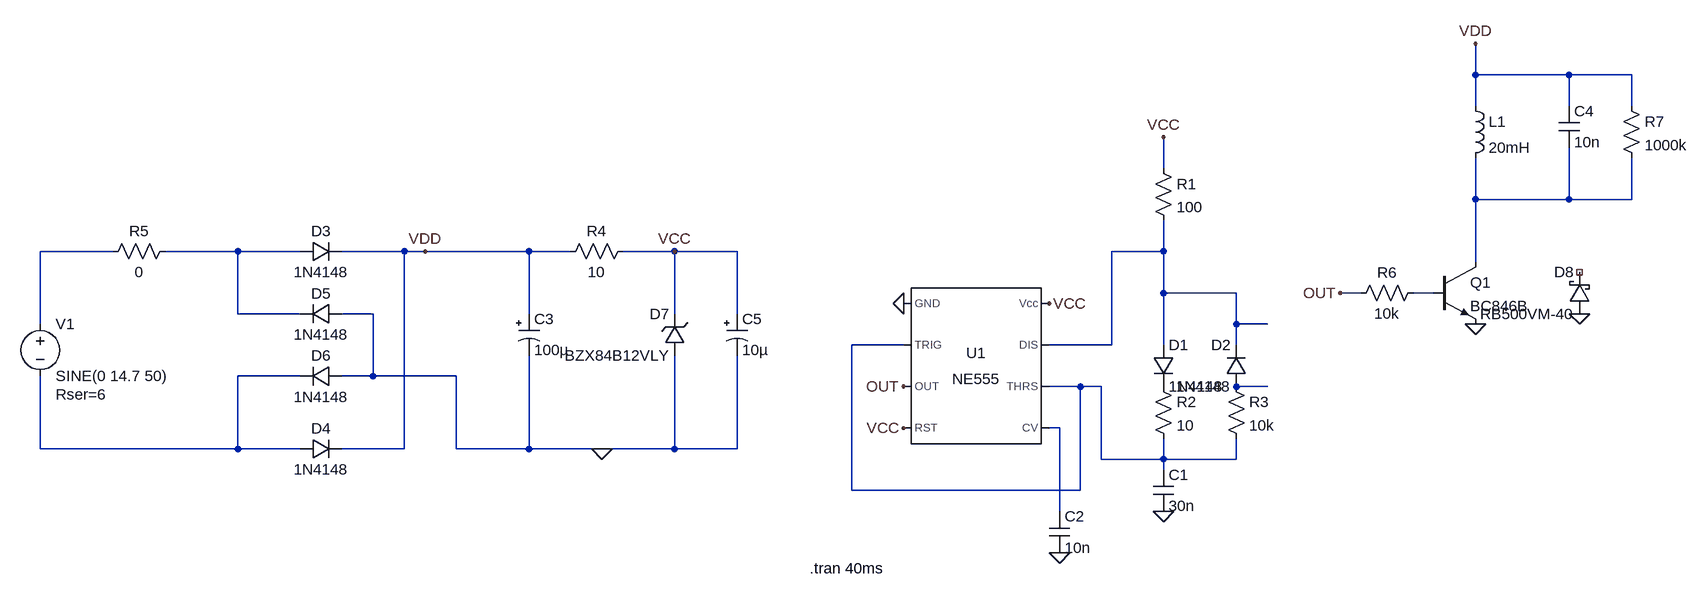
[diagram p0: schematic timer_555_astable.asc]
timer_555_astable.asc, the LTspice schematic file:
Version 4
SHEET 1 1328 680
WIRE 992 -256 992 -304
WIRE 1136 -256 992 -256
WIRE 1232 -256 1136 -256
WIRE 992 -208 992 -256
WIRE 1136 -208 1136 -256
WIRE 1232 -208 1232 -256
WIRE 512 -112 512 -160
WIRE 992 -64 992 -128
WIRE 1136 -64 1136 -144
WIRE 1136 -64 992 -64
WIRE 1232 -64 1232 -128
WIRE 1232 -64 1136 -64
WIRE -1104 16 -1216 16
WIRE -912 16 -1024 16
WIRE -816 16 -912 16
WIRE -656 16 -752 16
WIRE -624 16 -656 16
WIRE -464 16 -624 16
WIRE -400 16 -464 16
WIRE -240 16 -320 16
WIRE -144 16 -240 16
WIRE 512 16 512 -32
WIRE 512 16 432 16
WIRE 992 32 992 -64
WIRE 512 80 512 16
WIRE 624 80 512 80
WIRE 816 80 784 80
WIRE 928 80 896 80
WIRE -912 112 -912 16
WIRE -816 112 -912 112
WIRE -704 112 -752 112
WIRE -464 112 -464 16
WIRE -240 112 -240 16
WIRE -144 112 -144 16
WIRE -1216 128 -1216 16
WIRE 624 128 624 80
WIRE 672 128 624 128
WIRE 112 160 32 160
WIRE 432 160 432 16
WIRE 432 160 336 160
WIRE 512 160 512 80
WIRE 624 160 624 128
WIRE -816 208 -912 208
WIRE -704 208 -704 112
WIRE -704 208 -752 208
WIRE -576 208 -704 208
WIRE 384 224 336 224
WIRE 416 224 384 224
WIRE 672 224 624 224
WIRE 352 288 336 288
WIRE -1216 320 -1216 208
WIRE -912 320 -912 208
WIRE -912 320 -1216 320
WIRE -816 320 -912 320
WIRE -656 320 -656 16
WIRE -656 320 -752 320
WIRE -576 320 -576 208
WIRE -464 320 -464 176
WIRE -464 320 -576 320
WIRE -352 320 -464 320
WIRE -240 320 -240 176
WIRE -240 320 -352 320
WIRE -144 320 -144 176
WIRE -144 320 -240 320
WIRE 416 336 416 224
WIRE 512 336 512 304
WIRE 512 336 416 336
WIRE 624 336 624 304
WIRE 624 336 512 336
WIRE 512 352 512 336
WIRE 32 384 32 160
WIRE 384 384 384 224
WIRE 384 384 32 384
WIRE 352 416 352 288
FLAG 336 96 VCC
FLAG 112 96 0
FLAG 352 480 0
FLAG 512 416 0
FLAG 512 -160 VCC
FLAG 112 288 VCC
FLAG 112 224 OUT
FLAG -240 16 VCC
FLAG -352 320 0
FLAG -624 16 VDD
FLAG 992 -304 VDD
FLAG 992 128 0
FLAG 784 80 OUT
FLAG 1152 112 0
DATAFLAG 1136 -64 ""
DATAFLAG 1136 -64 ""
SYMBOL Misc\\NE555 224 192 R0
SYMATTR InstName U1
SYMBOL voltage -1216 112 R0
WINDOW 123 0 0 Left 2
WINDOW 39 24 124 Left 2
SYMATTR SpiceLine Rser=6
SYMATTR InstName V1
SYMATTR Value SINE(0 14.7 50)
SYMBOL res 496 -128 R0
SYMATTR InstName R1
SYMATTR Value 100
SYMBOL res 496 208 R0
SYMATTR InstName R2
SYMATTR Value 10
SYMBOL cap 496 352 R0
SYMATTR InstName C1
SYMATTR Value 30n
SYMBOL cap 336 416 R0
SYMATTR InstName C2
SYMATTR Value 10n
SYMBOL diode 496 160 R0
SYMATTR InstName D1
SYMATTR Value 1N4148
SYMBOL res 608 208 R0
SYMATTR InstName R3
SYMATTR Value 10k
SYMBOL diode 640 224 R180
WINDOW 0 24 64 Left 2
WINDOW 3 24 0 Left 2
SYMATTR InstName D2
SYMATTR Value 1N4148
SYMBOL diode -816 32 R270
WINDOW 0 32 32 VTop 2
WINDOW 3 0 32 VBottom 2
SYMATTR InstName D3
SYMATTR Value 1N4148
SYMBOL diode -816 336 R270
WINDOW 0 32 32 VTop 2
WINDOW 3 0 32 VBottom 2
SYMATTR InstName D4
SYMATTR Value 1N4148
SYMBOL diode -752 96 R90
WINDOW 0 0 32 VBottom 2
WINDOW 3 32 32 VTop 2
SYMATTR InstName D5
SYMATTR Value 1N4148
SYMBOL diode -752 192 R90
WINDOW 0 0 32 VBottom 2
WINDOW 3 32 32 VTop 2
SYMATTR InstName D6
SYMATTR Value 1N4148
SYMBOL polcap -480 112 R0
WINDOW 3 24 56 Left 2
SYMATTR Value 100µ
SYMATTR InstName C3
SYMATTR Description Capacitor
SYMATTR Type cap
SYMATTR SpiceLine V=63 Irms=260m Rser=0.31 Lser=0
SYMBOL res -1008 0 R90
WINDOW 0 0 56 VBottom 2
WINDOW 3 32 56 VTop 2
SYMATTR InstName R5
SYMATTR Value 0
SYMBOL res -416 32 R270
WINDOW 0 32 56 VTop 2
WINDOW 3 0 56 VBottom 2
SYMATTR InstName R4
SYMATTR Value 10
SYMBOL zener -224 176 R180
WINDOW 0 24 64 Left 2
WINDOW 3 24 0 Left 2
SYMATTR InstName D7
SYMATTR Value BZX84B12VLY
SYMATTR Description Diode
SYMATTR Type diode
SYMBOL polcap -160 112 R0
WINDOW 3 24 56 Left 2
SYMATTR Value 10µ
SYMATTR InstName C5
SYMATTR Description Capacitor
SYMATTR Type cap
SYMATTR SpiceLine V=63 Irms=135m Rser=1.06 Lser=0
SYMBOL npn 928 32 R0
SYMATTR InstName Q1
SYMATTR Value BC846B
SYMBOL res 912 64 R90
WINDOW 0 0 56 VBottom 2
WINDOW 3 32 56 VTop 2
SYMATTR InstName R6
SYMATTR Value 10k
SYMBOL ind 976 -224 R0
SYMATTR InstName L1
SYMATTR Value 20mH
SYMBOL cap 1120 -208 R0
SYMATTR InstName C4
SYMATTR Value 10n
SYMBOL res 1216 -224 R0
SYMATTR InstName R7
SYMATTR Value 1000k
SYMBOL schottky 1168 112 R180
WINDOW 0 24 64 Left 2
WINDOW 3 24 0 Left 2
SYMATTR InstName D8
SYMATTR Value RB500VM-40
SYMATTR Description Zener Diode
SYMATTR Type zener
TEXT -32 504 Left 2 !.tran 40ms

The netlist it stands for:
* timer_555_astable.asc
XU1 0 N006 OUT VCC N009 N006 N004 VCC NE555  ; pins GND TRIG OUT RST CV THRS DIS Vcc
V1 N002 N007 SINE(0 14.7 50) Rser=6
R1 VCC N004 100
R2 P001 N006 10
C1 N006 0 30n
C2 N009 0 10n
D1 N004 P001 1N4148
R3 N008 N006 10k
D2 N008 N004 1N4148
D3 N003 VDD 1N4148
D4 N007 VDD 1N4148
D5 0 N003 1N4148
D6 0 N007 1N4148
C3 VDD 0 100µ V=63 Irms=260m Rser=0.31 Lser=0
R5 N003 N002 0
R4 VDD VCC 10
D7 0 VCC BZX84B12VLY
C5 VCC 0 10µ V=63 Irms=135m Rser=1.06 Lser=0
Q1 N001 N005 0 0 BC846B
R6 N005 OUT 10k
L1 VDD N001 20mH
C4 VDD N001 10n
R7 VDD N001 1000k
D8 0 NC_01 RB500VM-40
.model D D
.lib standard.dio
.model NPN NPN
.model PNP PNP
.lib standard.bjt
.tran 40ms
.lib NE555.sub
.backanno
.end